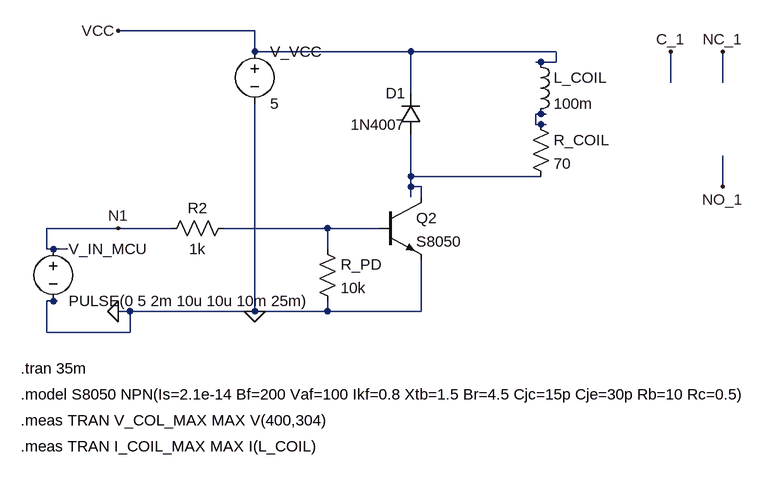
[diagram p0: schematic Driver_Rele_5V.asc]
Driver_Rele_5V.asc, the LTspice schematic file:
Version 4.1
SHEET 1 2400 1200
WIRE 160 80 -50 80
WIRE 160 112 160 80
WIRE 400 112 160 112
WIRE 624 112 400 112
WIRE 600 128 592 128
WIRE 624 128 624 112
WIRE 624 128 600 128
WIRE 800 160 800 112
WIRE 880 160 880 112
WIRE 400 176 400 112
WIRE 600 208 592 208
WIRE 608 208 600 208
WIRE 592 224 592 208
WIRE 600 224 592 224
WIRE 608 224 600 224
WIRE 400 304 400 240
WIRE 600 304 400 304
WIRE 400 320 400 304
WIRE 416 320 400 320
WIRE 880 320 880 272
WIRE 400 336 400 320
WIRE 416 336 416 320
WIRE -50 384 -160 384
WIRE 32 384 -50 384
WIRE 272 384 112 384
WIRE 352 384 272 384
WIRE -160 416 -160 384
WIRE -150 416 -160 416
WIRE -128 416 -150 416
WIRE 272 416 272 384
WIRE -150 496 -160 496
WIRE -144 496 -150 496
WIRE -32 512 -50 512
WIRE 160 512 160 192
WIRE 160 512 -32 512
WIRE 272 512 272 496
WIRE 272 512 160 512
WIRE 416 512 416 432
WIRE 416 512 272 512
WIRE -160 544 -160 496
WIRE -32 544 -32 512
WIRE -32 544 -160 544
FLAG -50 80 VCC
FLAG -50 384 N1
FLAG -50 512 0
FLAG 160 512 0
FLAG 800 112 C_1
FLAG 880 112 NC_1
FLAG 880 320 NO_1
SYMBOL voltage 160 96 R0
WINDOW 123 0 0 Left 2
WINDOW 39 0 0 Left 2
SYMATTR InstName V_VCC
SYMATTR Value 5
SYMBOL diode 416 240 R180
WINDOW 0 24 64 Left 2
WINDOW 3 24 16 Left 2
SYMATTR InstName D1
SYMATTR Value 1N4007
SYMBOL res 128 368 R90
WINDOW 0 0 56 VBottom 2
WINDOW 3 32 56 VTop 2
SYMATTR InstName R2
SYMATTR Value 1k
SYMBOL res 256 400 R0
SYMATTR InstName R_PD
SYMATTR Value 10k
SYMBOL npn 352 336 R0
SYMATTR InstName Q2
SYMATTR Value S8050
SYMBOL ind 584 112 R0
SYMATTR InstName L_COIL
SYMATTR Value 100m
SYMBOL res 584 208 R0
SYMATTR InstName R_COIL
SYMATTR Value 70
SYMBOL voltage -150 400 R0
WINDOW 123 0 0 Left 2
WINDOW 39 0 0 Left 2
SYMATTR InstName V_IN_MCU
SYMATTR Value PULSE(0 5 2m 10u 10u 10m 25m)
TEXT -200 600 Left 2 !.tran 35m
TEXT -200 640 Left 2 !.model S8050 NPN(Is=2.1e-14 Bf=200 Vaf=100 Ikf=0.8 Xtb=1.5 Br=4.5 Cjc=15p Cje=30p Rb=10 Rc=0.5)
TEXT -200 680 Left 2 !.meas TRAN V_COL_MAX MAX V(400,304)
TEXT -200 720 Left 2 !.meas TRAN I_COIL_MAX MAX I(L_COIL)

The netlist it stands for:
* Driver_Rele_5V.asc
V_VCC VCC 0 5
D1 N002 VCC 1N4007
R2 N003 N1 1k
R_PD N003 0 10k
Q2 N002 N003 0 0 S8050
L_COIL VCC N001 100m
R_COIL N001 N002 70
V_IN_MCU N1 0 PULSE(0 5 2m 10u 10u 10m 25m)
.model D D
.lib standard.dio
.model NPN NPN
.model PNP PNP
.lib standard.bjt
.tran 35m
.model S8050 NPN(Is=2.1e-14 Bf=200 Vaf=100 Ikf=0.8 Xtb=1.5 Br=4.5 Cjc=15p Cje=30p Rb=10 Rc=0.5)
.meas TRAN V_COL_MAX MAX V(400,304)
.meas TRAN I_COIL_MAX MAX I(L_COIL)
.backanno
.end